# Altium schematic sheet ICM_Mag.SchDoc
size B; SheetNumber: 1; SheetTotal: 1
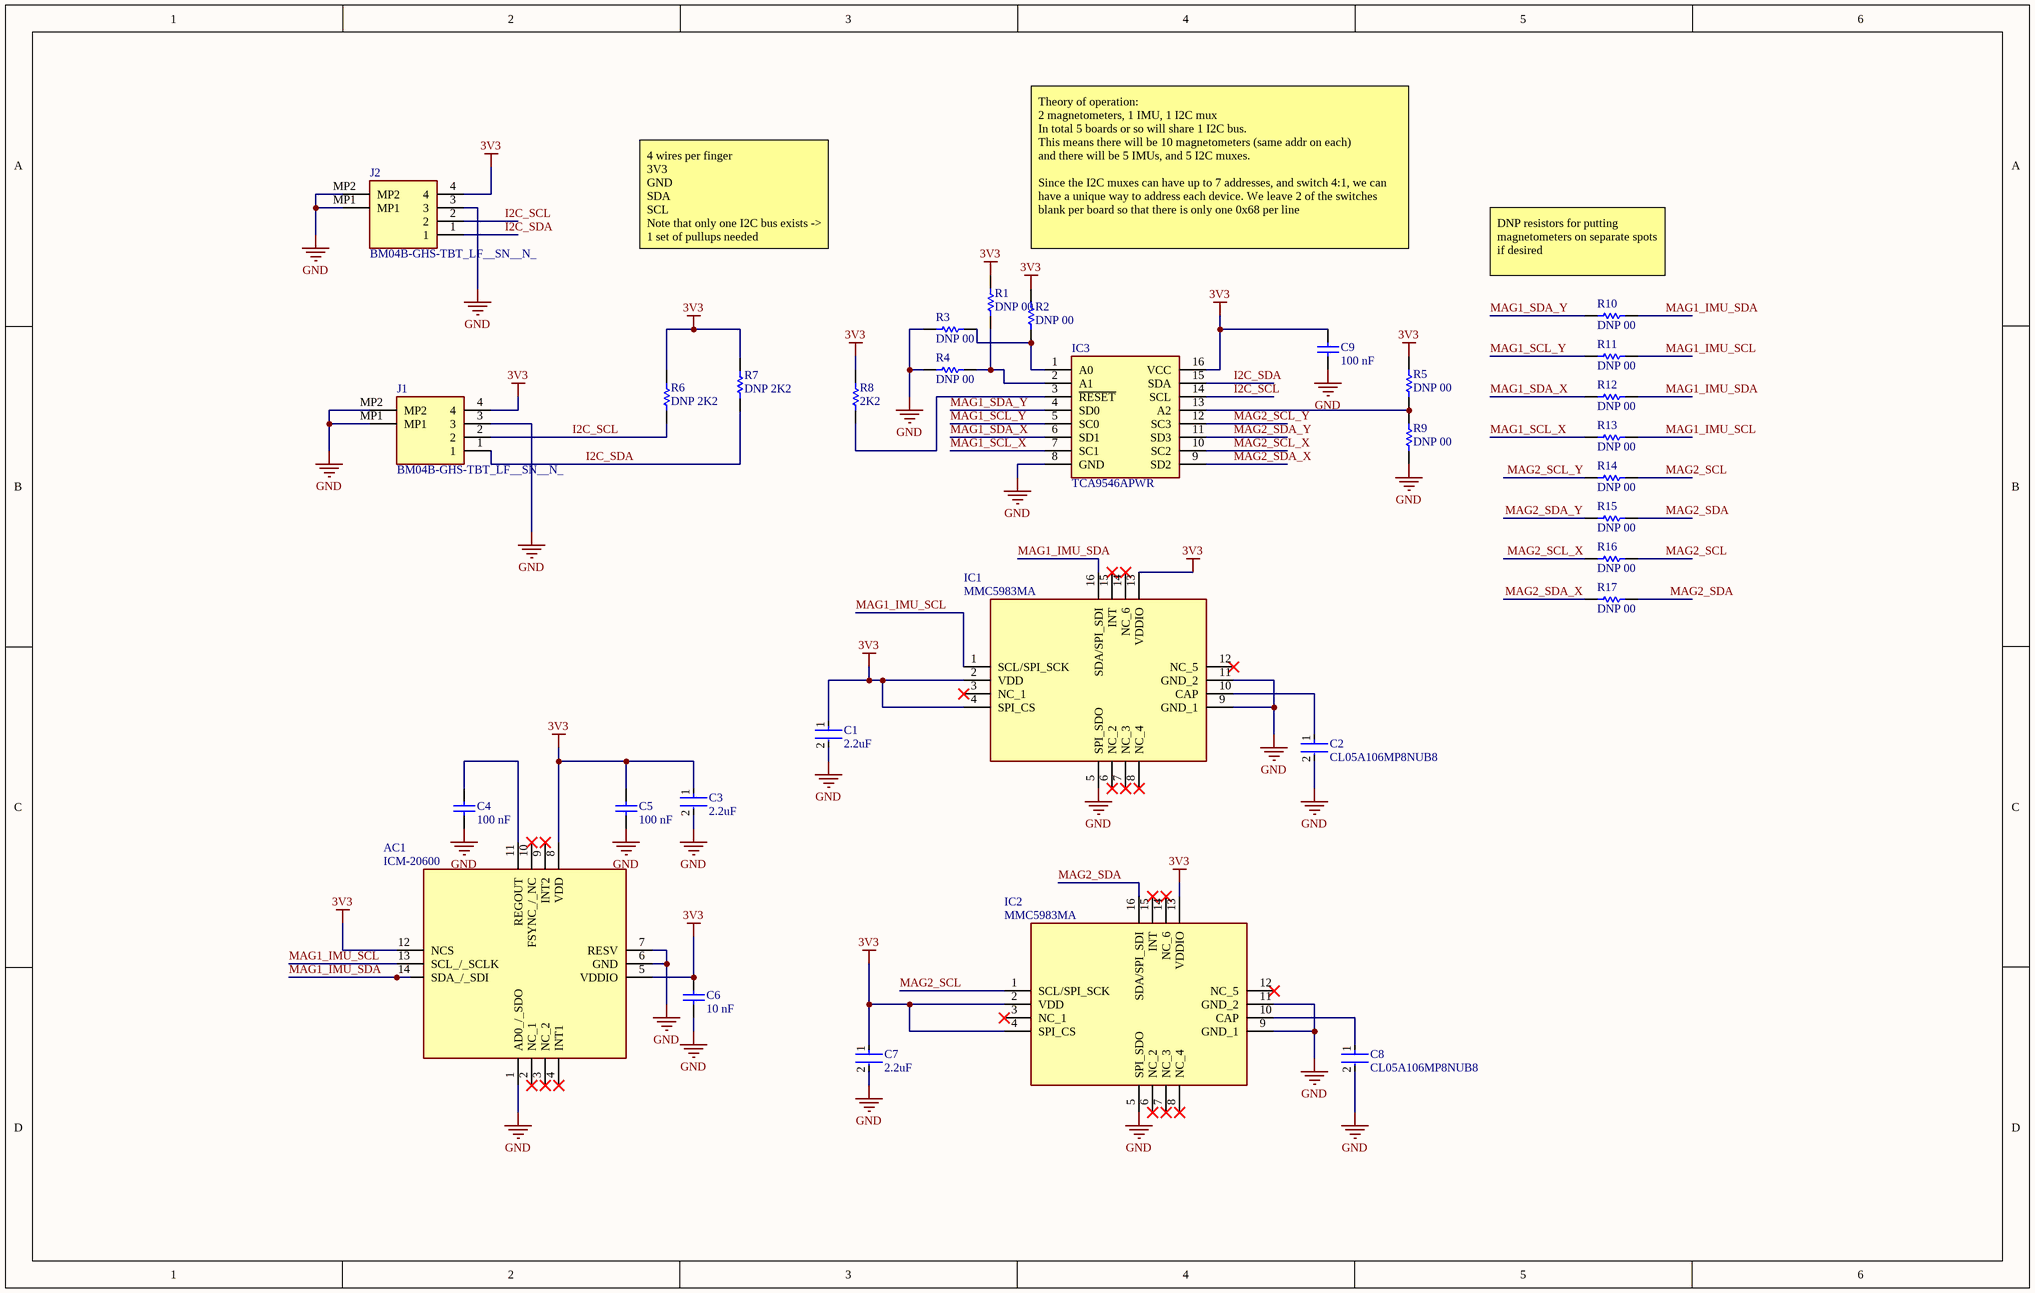
[diagram p0: ICM_Mag.SchDoc]

## Parts
AC1  ICM-20600  [IIM42352]
C1  2.2uF  [FP-0402-L_1_0_0_10-W_0_5-MFG]
C2  CL05A106MP8NUB8  [FP-CL07-IPC_C]
C3  2.2uF  [FP-0402-L_1_0_0_10-W_0_5-MFG]
C4  100 nF  [CAPC1005X56X25LL10T15]
C5  100 nF  [CAPC1005X56X25LL10T15]
C6  10 nF  [CAPC1005X56X25NL10T15]
C7  2.2uF  [FP-0402-L_1_0_0_10-W_0_5-MFG]
C8  CL05A106MP8NUB8  [FP-CL07-IPC_C]
C9  100 nF  [CAPC1005X56X25LL10T15]
IC1  MMC5983MA  [MMC5983MA]
IC2  MMC5983MA  [MMC5983MA]
IC3  TCA9546APWR  [SOP65P640X120-16N]
J1  BM04B-GHS-TBT_LF__SN__N_  [BM04BGHSTBTLFSNN]
J2  BM04B-GHS-TBT_LF__SN__N_  [BM04BGHSTBTLFSNN]
R1  DNP 00  [RESC0402(1005)_N]
R2  DNP 00  [RESC0402(1005)_N]
R3  DNP 00  [RESC0402(1005)_N]
R4  DNP 00  [RESC0402(1005)_N]
R5  DNP 00  [RESC0402(1005)_N]
R6  DNP 2K2  [RESC0402(1005)_N]
R7  DNP 2K2  [RESC0402(1005)_N]
R8  2K2  [RESC0402(1005)_N]
R9  DNP 00  [RESC0402(1005)_N]
R10  DNP 00  [RESC0402(1005)_N]
R11  DNP 00  [RESC0402(1005)_N]
R12  DNP 00  [RESC0402(1005)_N]
R13  DNP 00  [RESC0402(1005)_N]
R14  DNP 00  [RESC0402(1005)_N]
R15  DNP 00  [RESC0402(1005)_N]
R16  DNP 00  [RESC0402(1005)_N]
R17  DNP 00  [RESC0402(1005)_N]

## Nets
3V3: AC1.5(VDDIO) AC1.8(VDD) AC1.12(NCS) C1.1 C3.1 C5.2 C6.2 C7.1 C9.2 IC1.2(VDD) IC1.4(SPI_CS) IC1.13(VDDIO) IC2.2(VDD) IC2.4(SPI_CS) IC2.13(VDDIO) IC3.16(VCC) J1.4 J2.4 R1.2 R2.2 R5.2 R6.2 R7.2 R8.2
GND: AC1.1(AD0_/_SDO) AC1.6(GND) AC1.7(RESV) C1.2 C2.2 C3.2 C4.1 C5.1 C6.1 C7.2 C8.2 C9.1 IC1.5(SPI_SDO) IC1.9(GND_1) IC1.11(GND_2) IC2.5(SPI_SDO) IC2.9(GND_1) IC2.11(GND_2) IC3.8(GND) J1.3 J1.MP1 J1.MP2 J2.3 J2.MP1 J2.MP2 R3.2 R4.1 R9.1
I2C_SCL: IC3.14(SCL) J1.2 J2.2 R6.1
I2C_SDA: IC3.15(SDA) J1.1 J2.1 R7.1
MAG1_IMU_SCL: AC1.13(SCL_/_SCLK) IC1.1(SCL/SPI_SCK) R11.1 R13.1
MAG1_IMU_SDA: AC1.14(SDA_/_SDI) IC1.16(SDA/SPI_SDI) R10.1 R12.1
MAG1_SCL_X: IC3.7(SC1) R13.2
MAG1_SCL_Y: IC3.5(SC0) R11.2
MAG1_SDA_X: IC3.6(SD1) R12.2
MAG1_SDA_Y: IC3.4(SD0) R10.2
MAG2_SCL: IC2.1(SCL/SPI_SCK) R14.1 R16.1
MAG2_SCL_X: IC3.10(SC2) R16.2
MAG2_SCL_Y: IC3.12(SC3) R14.2
MAG2_SDA: IC2.16(SDA/SPI_SDI) R15.1 R17.1
MAG2_SDA_X: IC3.9(SD2) R17.2
MAG2_SDA_Y: IC3.11(SD3) R15.2
NetAC1_11: AC1.11(REGOUT) C4.2
NetC2_1: C2.1 IC1.10(CAP)
NetC8_1: C8.1 IC2.10(CAP)
NetIC3_1: IC3.1(A0) R2.1 R3.1
NetIC3_2: IC3.2(A1) R1.1 R4.2
NetIC3_3: IC3.3(~{RESET}) R8.1
NetIC3_13: IC3.13(A2) R5.1 R9.2

Not connected (* = marked no-connect by the designer): AC1 2(NC_1)* 3(NC_2)* 4(INT1)* 9(INT2)* 10(FSYNC_/_NC)*; IC1 3(NC_1)* 6(NC_2)* 7(NC_3)* 8(NC_4)* 12(NC_5)* 14(NC_6)* 15(INT)*; IC2 3(NC_1)* 6(NC_2)* 7(NC_3)* 8(NC_4)* 12(NC_5)* 14(NC_6)* 15(INT)*

## Notes on the sheet
- 4 wires per finger
  3V3
  GND
  SDA
  SCL
  Note that only one I2C bus exists -> 1 set of pullups needed
- Theory of operation:
  2 magnetometers, 1 IMU, 1 I2C mux
  In total 5 boards or so will share 1 I2C bus.
  This means there will be 10 magnetometers (same addr on each)
  and there will be 5 IMUs, and 5 I2C muxes.
  Since the I2C muxes can have up to 7 addresses, and switch 4:1, we can have a unique way to address each device. We leave 2 of the switches blank per board so that there is only one 0x68 per line
- (near R10) DNP resistors for putting magnetometers on separate spots if desired

## Library data of the parts
AC1 = ICM-20600: Accelerometer; Manufacturer_Name: TDK; Datasheet Link: https://3cfeqx1hf82y3xcoull08ihx-wpengine.netdna-ssl.com/wp-content/uploads/2021/05/DS-000184-ICM-20600-v1.1.pdf; Manufacturer_Part_Number: ICM-20600; Mouser Part Number: 410-ICM-20600; Mouser Price/Stock: https://www.mouser.co.uk/ProductDetail/TDK-InvenSense/ICM-20600?qs=u4fy%2FsgLU9MI5QhQvsMoRw%3D%3D; Arrow Part Number: ICM-20600; Arrow Price/Stock: null?region=nac
C1 C3 C7 = CMP-14477-002382-2: LMK105ABJ225MVHF; Tolerance: 20%; Voltage Rating (DC): 10V; Halogen Free: Halogen Free; Min Operating Temperature: -55°C; Capacitance: 2.2uF; Ratings: AEC-Q200; Case/Package: 0402; Lead Free: Lead Free; Thickness: 0.024inch; Width: 0.02inch; RoHS Compliant: Yes; Case Code (Imperial): 0402; Max Operating Temperature: 85°C; Packaging: Tape and Reel; Length: 0.039inch; Case Code (Metric): 1005; Mount: Surface Mount; Voltage Rating: 10V
C2 C8 = CMP-13271-002778-1: Cap Ceramic 10uF 10V X5R ±20% SMD 0402 +85°C Paper T/R; Length: 0.039inch; Mount: Surface Mount; Case Code (Imperial): 0402; Capacitance: 10uF; Max Operating Temperature: 85°C; Voltage Rating: 10V; Min Operating Temperature: -55°C; Case/Package: 0402; Thickness: 0.035inch; Width: 0.02inch; Case Code (Metric): 1005; Packaging: Tape and Reel; Tolerance: 20%
C4 C5 C9 = CMP-2008-02972-1: 04023C104JAT2A; Manufacturer: AVX Interconnect / Elco; Part Number: 04023C104JAT2A
C6 = CMP-2008-02877-1: 0402ZD103KAT2A; Manufacturer: AVX Interconnect / Elco; Part Number: 0402ZD103KAT2A
IC1 IC2 = MMC5983MA: Integrated Circuit; Manufacturer_Name: MEMSIC; Datasheet Link: https://www.mouser.com/datasheet/2/821/Memsic_09102019_MMC5983MA_Datasheet_Rev_A-1635338.pdf; Height: 1mm; Manufacturer_Part_Number: MMC5983MA; Mouser Part Number: 438-MMC5983MA; Mouser Price/Stock: https://www.mouser.co.uk/ProductDetail/MEMSIC/MMC5983MA?qs=B6kkDfuK7%2FD5qasHMdEt2g%3D%3D; Arrow Part Number: MMC5983MA; Arrow Price/Stock: https://www.arrow.com/en/products/mmc5983ma/memsic.html?utm_currency=USD&region=europe
IC3 = TCA9546APWR: Integrated Circuit; Manufacturer_Name: Texas Instruments; Datasheet Link: http://www.ti.com/lit/gpn/tca9546a; Height: 1.2mm; Manufacturer_Part_Number: TCA9546APWR; Mouser Part Number: 595-TCA9546APWR; Mouser Price/Stock: https://www.mouser.co.uk/ProductDetail/Texas-Instruments/TCA9546APWR?qs=hNud%2FORuBR3YgtCnSrHnJg%3D%3D; Arrow Part Number: TCA9546APWR; Arrow Price/Stock: https://www.arrow.com/en/products/tca9546apwr/texas-instruments.html?utm_currency=USD&region=asia
J1 J2 = BM04B-GHS-TBT_LF__SN__N_: Connector; Manufacturer_Name: JST (JAPAN SOLDERLESS TERMINALS); Manufacturer_Part_Number: BM04B-GHS-TBT(LF)(SN)(N); Datasheet Link: http://www.jst-mfg.com/product/pdf/eng/eGH.pdf; Height: 4.05mm; Mouser Part Number: N/A; Mouser Price/Stock: https://www.mouser.co.uk/ProductDetail/JST-Commercial/BM04B-GHS-TBTLFSNN?qs=QpmGXVUTftGHKxacCgPJ1g%3D%3D; Arrow Part Number: BM04B-GHS-TBT(LF)(SN)(N); Arrow Price/Stock: https://www.arrow.com/en/products/bm04b-ghs-tbt-lf-sn-n/jst-manufacturing.html?utm_currency=USD&region=asia
R1-R17 = CMP-1011-00082-1: 2K2 0.063W 5% 0402 (1005 Metric)  SMD; Value: 2200.00 Ohm; Case-EIA: 0402; Case-Metric: 1005; Tolerance: 5 %; Power: 0.063 W; Technology: SMT